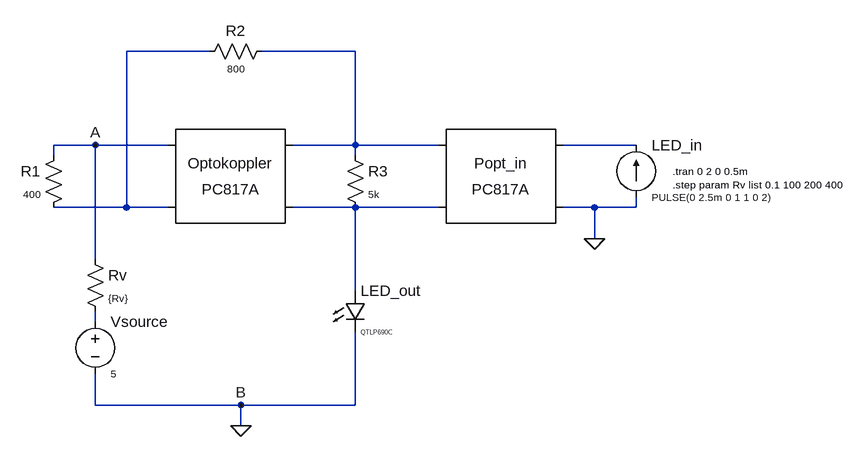
[diagram p0: schematic 07_Schmitt_Vorlage_R1-400_R2-800_R3-5k.asc]
07_Schmitt_Vorlage_R1-400_R2-800_R3-5k.asc, the LTspice schematic file:
Version 4
SHEET 1 1720 680
WIRE 448 80 320 80
WIRE 672 80 528 80
WIRE 272 224 208 224
WIRE 384 224 272 224
WIRE 672 224 672 80
WIRE 672 224 576 224
WIRE 800 224 672 224
WIRE 1104 224 992 224
WIRE 208 240 208 224
WIRE 672 240 672 224
WIRE 320 320 320 80
WIRE 320 320 208 320
WIRE 384 320 320 320
WIRE 672 320 576 320
WIRE 800 320 672 320
WIRE 1040 320 992 320
WIRE 1104 320 1104 304
WIRE 1104 320 1040 320
WIRE 1040 368 1040 320
WIRE 272 400 272 224
WIRE 672 448 672 320
WIRE 272 496 272 480
WIRE 272 624 272 576
WIRE 496 624 272 624
WIRE 672 624 672 512
WIRE 672 624 496 624
WIRE 496 656 496 624
FLAG 496 656 0
FLAG 1040 368 0
FLAG 272 224 A
FLAG 496 624 B
SYMBOL res 224 224 M0
WINDOW 3 36 76 Left 1
SYMATTR InstName R1
SYMATTR Value 400
SYMBOL res 256 384 R0
WINDOW 3 36 76 Left 1
SYMATTR InstName Rv
SYMATTR Value {Rv}
SYMBOL res 656 224 R0
WINDOW 3 36 76 Left 1
SYMATTR InstName R3
SYMATTR Value 5k
SYMBOL res 432 96 R270
WINDOW 0 32 56 VTop 2
WINDOW 3 0 56 VBottom 1
SYMATTR InstName R2
SYMATTR Value 800
SYMBOL LED 656 448 R0
WINDOW 3 24 64 Left 0
SYMATTR Value QTLP690C
SYMATTR InstName LED_out
SYMATTR Description Diode
SYMATTR Type diode
SYMBOL Optos/PC817A 480 272 R0
SYMATTR InstName Optokoppler
SYMBOL voltage 272 480 R0
WINDOW 3 24 96 Left 1
SYMATTR Value 5
SYMATTR InstName Vsource
SYMBOL Optos/PC817A 896 272 M0
SYMATTR InstName Popt_in
SYMBOL current 1104 304 M180
WINDOW 0 24 80 Left 2
WINDOW 3 24 0 Left 1
SYMATTR InstName LED_in
SYMATTR Value PULSE(0 2.5m 0 1 1 0 2)
TEXT 1160 264 Left 1 !.tran 0 2 0 0.5m\n.step param Rv list 0.1 100 200 400

The netlist it stands for:
* 07_Schmitt_Vorlage_R1-400_R2-800_R3-5k.asc
R1 A N001 400
Rv A N005 {Rv}
R3 N002 N004 5k
R2 N001 N002 800
D§LED_out N004 0 QTLP690C
XOptokoppler A N001 N002 N004 PC817 Igain=1m
Vsource N005 0 5
XPopt_in N003 0 N002 N004 PC817 Igain=1m
I§LED_in 0 N003 PULSE(0 2.5m 0 1 1 0 2)
.model D D
.lib standard.dio
.tran 0 2 0 0.5m
.step param Rv list 0.1 100 200 400
.lib PC817.sub
.backanno
.end